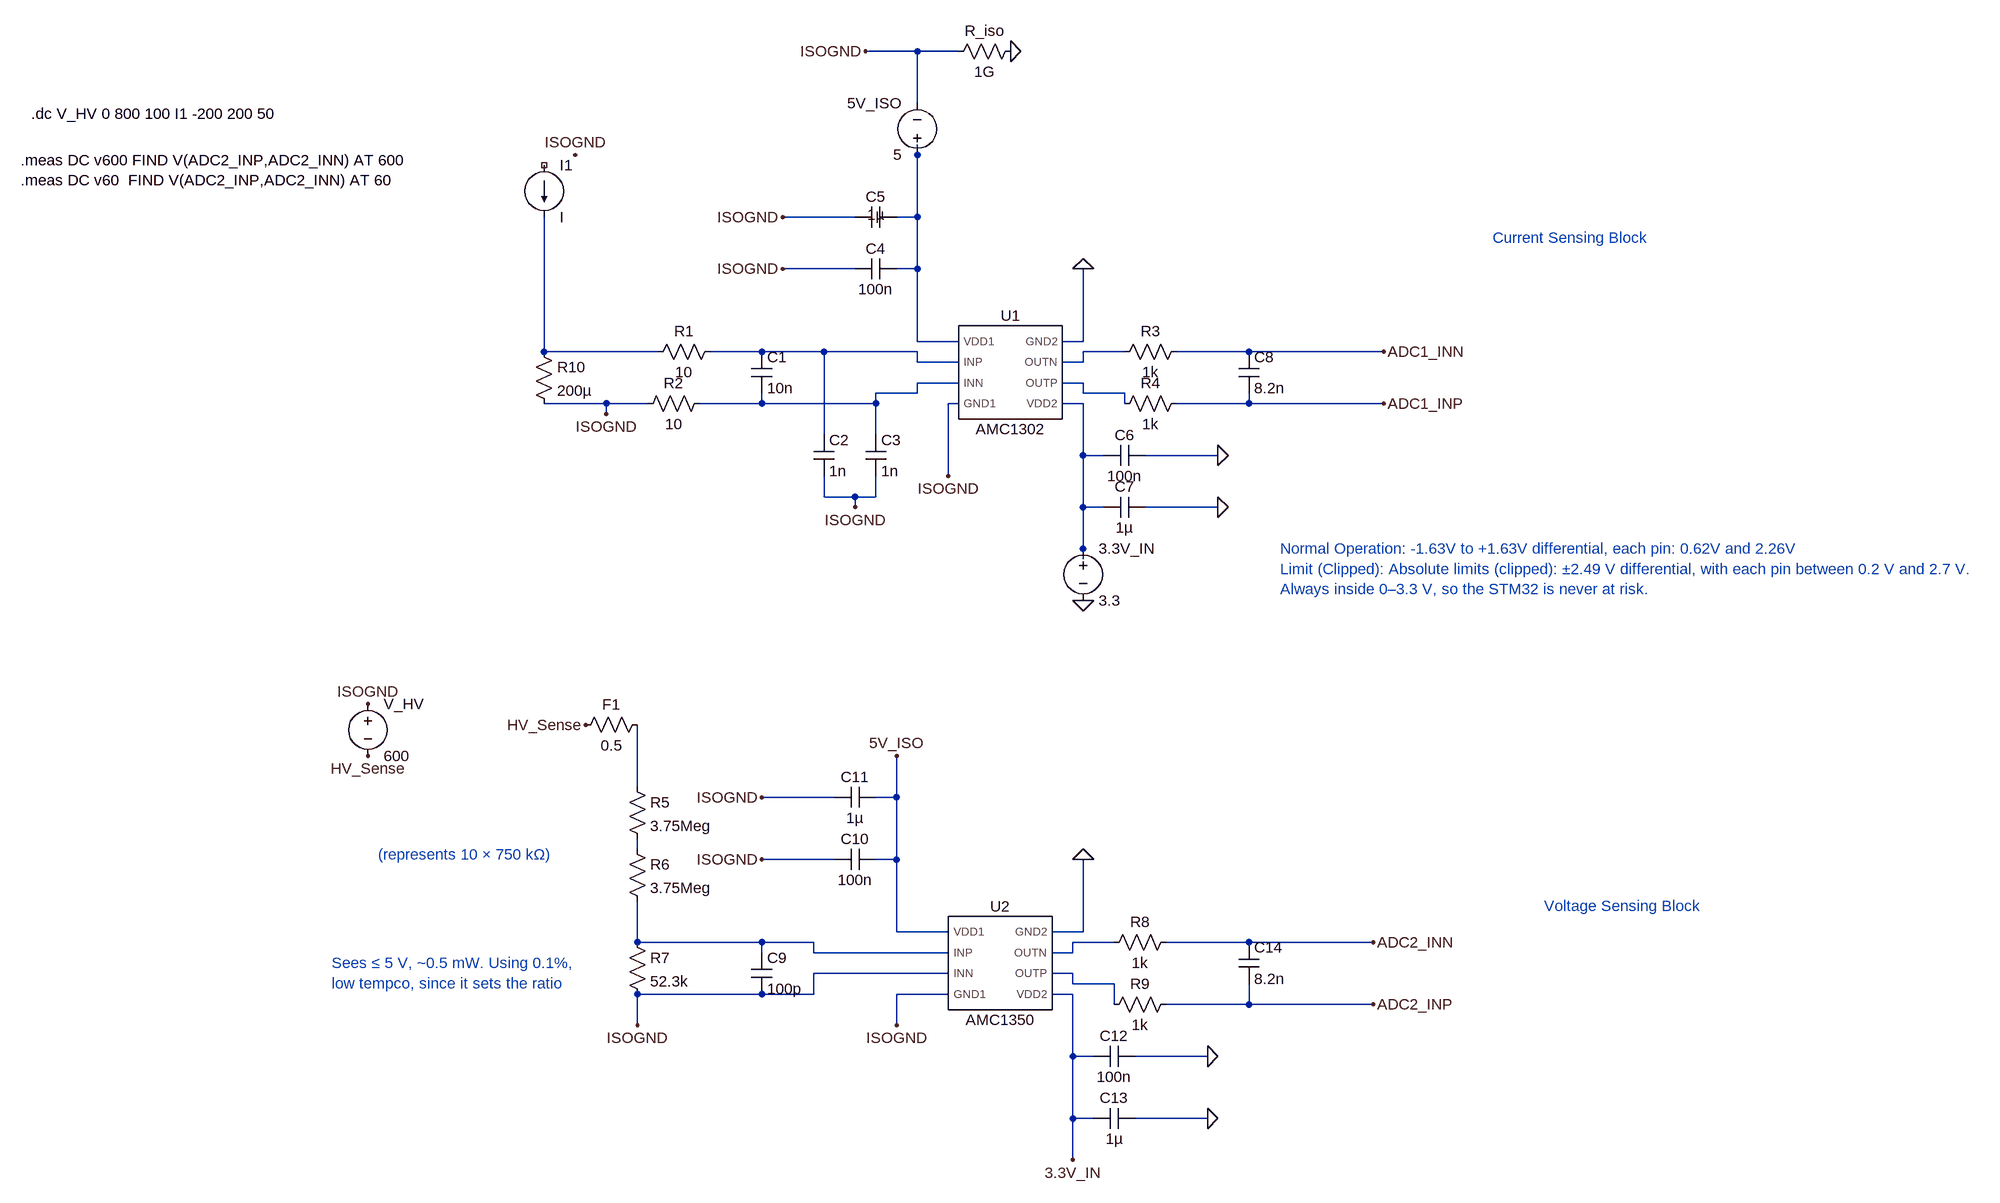
[diagram p0: schematic Draft1.asc]
Draft1.asc, the LTspice schematic file:
Version 4.1
SHEET 1 2132 1664
WIRE 384 -304 304 -304
WIRE 448 -304 384 -304
WIRE 384 -224 384 -304
WIRE 384 -144 384 -160
WIRE 288 -48 176 -48
WIRE 384 -48 384 -144
WIRE 384 -48 352 -48
WIRE 288 32 176 32
WIRE 384 32 384 -48
WIRE 384 32 352 32
WIRE 384 144 384 32
WIRE 448 144 384 144
WIRE 640 144 640 32
WIRE 640 144 608 144
WIRE -192 160 -192 -48
WIRE -16 160 -192 160
WIRE 144 160 64 160
WIRE 240 160 144 160
WIRE 384 160 240 160
WIRE 704 160 640 160
WIRE 896 160 784 160
WIRE 1104 160 896 160
WIRE 384 176 384 160
WIRE 448 176 384 176
WIRE 640 176 640 160
WIRE 640 176 608 176
WIRE 448 208 384 208
WIRE 640 208 608 208
WIRE 384 224 384 208
WIRE 384 224 320 224
WIRE 640 224 640 208
WIRE 704 224 640 224
WIRE -96 240 -192 240
WIRE -32 240 -96 240
WIRE 144 240 144 224
WIRE 144 240 48 240
WIRE 320 240 320 224
WIRE 320 240 144 240
WIRE 448 240 432 240
WIRE 640 240 608 240
WIRE 704 240 704 224
WIRE 896 240 896 224
WIRE 896 240 784 240
WIRE 1104 240 896 240
WIRE -96 256 -96 240
WIRE 240 288 240 160
WIRE 320 288 320 240
WIRE 640 320 640 240
WIRE 672 320 640 320
WIRE 848 320 736 320
WIRE 432 352 432 240
WIRE 240 384 240 352
WIRE 288 384 240 384
WIRE 320 384 320 352
WIRE 320 384 288 384
WIRE 288 400 288 384
WIRE 640 400 640 320
WIRE 672 400 640 400
WIRE 848 400 736 400
WIRE 640 464 640 400
WIRE 640 480 640 464
WIRE -48 832 -48 736
WIRE 256 848 144 848
WIRE 352 848 352 784
WIRE 352 848 320 848
WIRE -48 928 -48 912
WIRE 256 944 144 944
WIRE 352 944 352 848
WIRE 352 944 320 944
WIRE 352 1056 352 944
WIRE 432 1056 352 1056
WIRE 640 1056 640 944
WIRE 640 1056 592 1056
WIRE -48 1072 -48 1008
WIRE 144 1072 -48 1072
WIRE 224 1072 144 1072
WIRE 688 1072 624 1072
WIRE 896 1072 768 1072
WIRE 1088 1072 896 1072
WIRE 144 1088 144 1072
WIRE 224 1088 224 1072
WIRE 432 1088 224 1088
WIRE 624 1088 624 1072
WIRE 624 1088 592 1088
WIRE 432 1120 224 1120
WIRE 624 1120 592 1120
WIRE 624 1136 624 1120
WIRE 688 1136 624 1136
WIRE 144 1152 -48 1152
WIRE 224 1152 224 1120
WIRE 224 1152 144 1152
WIRE 432 1152 352 1152
WIRE 624 1152 592 1152
WIRE 688 1168 688 1136
WIRE 896 1168 896 1136
WIRE 896 1168 768 1168
WIRE 1088 1168 896 1168
WIRE -48 1200 -48 1152
WIRE 352 1200 352 1152
WIRE 624 1248 624 1152
WIRE 656 1248 624 1248
WIRE 832 1248 720 1248
WIRE 624 1344 624 1248
WIRE 656 1344 624 1344
WIRE 832 1344 720 1344
WIRE 624 1408 624 1344
FLAG 176 -48 ISOGND
FLAG 176 32 ISOGND
FLAG 432 352 ISOGND
FLAG -48 1200 ISOGND
FLAG 144 848 ISOGND
FLAG 144 944 ISOGND
FLAG 352 1200 ISOGND
FLAG 848 400 0
FLAG 848 320 0
FLAG 640 32 0
FLAG 832 1344 0
FLAG 832 1248 0
FLAG 1104 160 ADC1_INN
FLAG 1104 240 ADC1_INP
FLAG 1088 1168 ADC2_INP
FLAG 1088 1072 ADC2_INN
FLAG 288 400 ISOGND
FLAG 352 784 5V_ISO
FLAG 624 1408 3.3V_IN
FLAG -96 256 ISOGND
FLAG 304 -304 ISOGND
FLAG 640 544 0
FLAG 528 -304 0
FLAG 640 944 0
FLAG -128 736 HV_Sense
FLAG -464 704 ISOGND
FLAG -464 784 HV_Sense
FLAG -144 -144 ISOGND
SYMBOL res 80 144 R90
WINDOW 0 0 56 VBottom 2
WINDOW 3 32 56 VTop 2
SYMATTR InstName R1
SYMATTR Value 10
SYMBOL res 64 224 R90
WINDOW 0 0 56 VBottom 2
WINDOW 3 32 56 VTop 2
SYMATTR InstName R2
SYMATTR Value 10
SYMBOL cap 128 160 R0
SYMATTR InstName C1
SYMATTR Value 10n
SYMBOL cap 224 288 R0
SYMATTR InstName C2
SYMATTR Value 1n
SYMBOL cap 304 288 R0
SYMATTR InstName C3
SYMATTR Value 1n
SYMBOL cap 352 16 R90
WINDOW 0 0 32 VBottom 2
WINDOW 3 32 32 VTop 2
SYMATTR InstName C4
SYMATTR Value 100n
SYMBOL cap 352 -64 R90
WINDOW 0 0 32 VBottom 2
WINDOW 3 28 32 VBottom 2
SYMATTR InstName C5
SYMATTR Value 1µ
SYMBOL AMC1302 528 192 R0
SYMATTR InstName U1
SYMBOL cap 672 336 R270
WINDOW 0 32 32 VTop 2
WINDOW 3 0 32 VBottom 2
SYMATTR InstName C6
SYMATTR Value 100n
SYMBOL cap 672 416 R270
WINDOW 0 32 32 VTop 2
WINDOW 3 0 32 VBottom 2
SYMATTR InstName C7
SYMATTR Value 1µ
SYMBOL res 800 224 R90
WINDOW 0 0 56 VBottom 2
WINDOW 3 32 56 VTop 2
SYMATTR InstName R4
SYMATTR Value 1k
SYMBOL res 800 144 R90
WINDOW 0 0 56 VBottom 2
WINDOW 3 32 56 VTop 2
SYMATTR InstName R3
SYMATTR Value 1k
SYMBOL cap 880 160 R0
SYMATTR InstName C8
SYMATTR Value 8.2n
SYMBOL res -64 816 R0
SYMATTR InstName R5
SYMATTR Value 3.75Meg
SYMBOL res -64 912 R0
SYMATTR InstName R6
SYMATTR Value 3.75Meg
SYMBOL res -64 1056 R0
SYMATTR InstName R7
SYMATTR Value 52.3k
SYMBOL cap 128 1088 R0
SYMATTR InstName C9
SYMATTR Value 100p
SYMBOL AMC1350 512 1104 R0
SYMATTR InstName U2
SYMBOL cap 320 928 R90
WINDOW 0 0 32 VBottom 2
WINDOW 3 32 32 VTop 2
SYMATTR InstName C10
SYMATTR Value 100n
SYMBOL cap 320 832 R90
WINDOW 0 0 32 VBottom 2
WINDOW 3 32 32 VTop 2
SYMATTR InstName C11
SYMATTR Value 1µ
SYMBOL cap 656 1264 R270
WINDOW 0 32 32 VTop 2
WINDOW 3 0 32 VBottom 2
SYMATTR InstName C12
SYMATTR Value 100n
SYMBOL cap 656 1360 R270
WINDOW 0 32 32 VTop 2
WINDOW 3 0 32 VBottom 2
SYMATTR InstName C13
SYMATTR Value 1µ
SYMBOL res 784 1056 R90
WINDOW 0 0 56 VBottom 2
WINDOW 3 32 56 VTop 2
SYMATTR InstName R8
SYMATTR Value 1k
SYMBOL res 784 1152 R90
WINDOW 0 0 56 VBottom 2
WINDOW 3 32 56 VTop 2
SYMATTR InstName R9
SYMATTR Value 1k
SYMBOL cap 880 1072 R0
SYMATTR InstName C14
SYMATTR Value 8.2n
SYMBOL res -208 144 R0
SYMATTR InstName R10
SYMATTR Value 200µ
SYMBOL current -192 -128 R0
SYMATTR InstName I1
SYMBOL voltage 384 -128 R180
WINDOW 0 24 96 Left 2
WINDOW 3 24 16 Left 2
WINDOW 123 0 0 Left 0
WINDOW 39 0 0 Left 0
SYMATTR InstName 5V_ISO
SYMATTR Value 5
SYMBOL voltage 640 448 R0
WINDOW 123 0 0 Left 0
WINDOW 39 0 0 Left 0
SYMATTR InstName 3.3V_IN
SYMATTR Value 3.3
SYMBOL res 544 -320 R90
WINDOW 0 0 56 VBottom 2
WINDOW 3 32 56 VTop 2
SYMATTR InstName R_iso
SYMATTR Value 1G
SYMBOL res -32 720 R90
WINDOW 0 0 56 VBottom 2
WINDOW 3 32 56 VTop 2
SYMATTR InstName F1
SYMATTR Value 0.5
SYMBOL voltage -464 688 R0
WINDOW 123 0 0 Left 0
WINDOW 39 0 0 Left 0
SYMATTR InstName V_HV
SYMATTR Value 600
TEXT 1272 -16 Left 2 ;Current Sensing Block
TEXT 1352 1016 Left 2 ;Voltage Sensing Block
TEXT 944 464 Left 2 ;Normal Operation: -1.63V to +1.63V differential, each pin: 0.62V and 2.26V\nLimit (Clipped): Absolute limits (clipped): ±2.49 V differential, with each pin between 0.2 V and 2.7 V. \nAlways inside 0–3.3 V, so the STM32 is never at risk.
TEXT -448 936 Left 2 ;(represents 10 × 750 kΩ)
TEXT -520 1104 Left 2 ;Sees ≤ 5 V, ~0.5 mW. Using 0.1%, \nlow tempco, since it sets the ratio
TEXT -984 -208 Left 2 !.dc V_HV 0 800 100 I1 -200 200 50
TEXT -1000 -136 Left 2 !.meas DC v600 FIND V(ADC2_INP,ADC2_INN) AT 600\n.meas DC v60  FIND V(ADC2_INP,ADC2_INN) AT 60

The netlist it stands for:
* Draft1.asc
R1 N003 N002 10
R2 N005 ISOGND 10
C1 N003 N005 10n
C2 N003 ISOGND 1n
C3 N005 ISOGND 1n
C4 N001 ISOGND 100n
C5 N001 ISOGND 1µ
X§U1 N001 N003 N005 ISOGND 0 N004 N006 N007 AMC1302  ; pins VDD1 INP INN GND1 GND2 OUTN OUTP VDD2
C6 N007 0 100n
C7 N007 0 1µ
R4 ADC1_INP N006 1k
R3 ADC1_INN N004 1k
C8 ADC1_INN ADC1_INP 8.2n
R5 N008 N009 3.75Meg
R6 N009 N010 3.75Meg
R7 N010 ISOGND 52.3k
C9 N010 ISOGND 100p
X§U2 5V_ISO N010 ISOGND ISOGND 0 N011 N012 3.3V_IN AMC1350  ; pins VDD1 INP INN GND1 GND2 OUTN OUTP VDD2
C10 5V_ISO ISOGND 100n
C11 5V_ISO ISOGND 1µ
C12 3.3V_IN 0 100n
C13 3.3V_IN 0 1µ
R8 ADC2_INN N011 1k
R9 ADC2_INP N012 1k
C14 ADC2_INN ADC2_INP 8.2n
R10 N002 ISOGND 200µ
I1 NC_01 N002 I
V§5V_ISO N001 ISOGND 5
V§3.3V_IN N007 0 3.3
R_iso 0 ISOGND 1G
R§F1 N008 HV_Sense 0.5
V_HV ISOGND HV_Sense 600
* Current Sensing Block
* Voltage Sensing Block
* Normal Operation: -1.63V to +1.63V differential, each pin: 0.62V and 2.26V
* Limit (Clipped): Absolute limits (clipped): ±2.49 V differential, with each pin between 0.2 V and 2.7 V.
* Always inside 0–3.3 V, so the STM32 is never at risk.
* (represents 10 × 750 kΩ)
* Sees ≤ 5 V, ~0.5 mW. Using 0.1%,
* low tempco, since it sets the ratio
.dc V_HV 0 800 100 I1 -200 200 50
.meas DC v600 FIND V(ADC2_INP,ADC2_INN) AT 600
.meas DC v60  FIND V(ADC2_INP,ADC2_INN) AT 60
.lib Amc1302.lib
.lib AMC1350.lib
.backanno
.end